# Altium schematic sheet MotorControl.SchDoc
size A
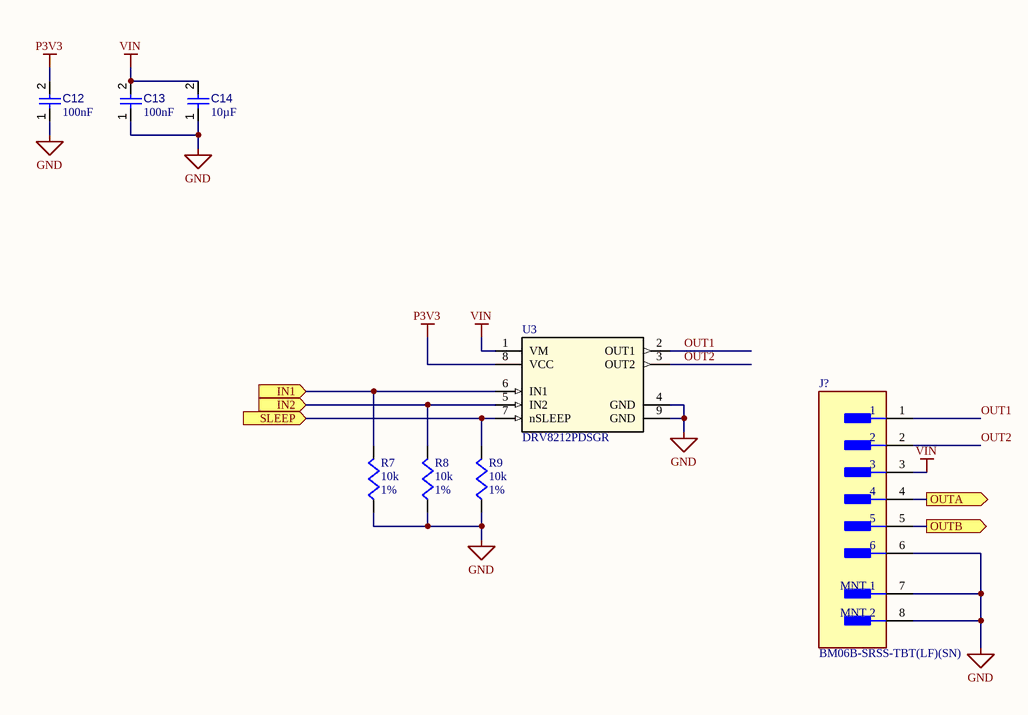
[diagram p0: MotorControl.SchDoc]

## Parts
C12  value 100nF  [CAPC0402(1005)60_L]  (hidden comment: Capacitor 100nF +/-20% 25V 0402)
C13  value 100nF  [CAPC0402(1005)60_L]  (hidden comment: Capacitor 100nF +/-20% 25V 0402)
C14  value 10µF  [CAPC2013X135X45NL10T25]  (hidden comment: Capacitor 10 uF +/- 10% 16 V 0805)
J?  BM06B-SRSS-TBT(LF)(SN)  [FP-BM06B-SRSS-TBT_LF_SN-MFG]
R7  value 10k  Tolerance: 1%  [R0402]  (hidden comment: 10k 1% 0402)
R8  value 10k  Tolerance: 1%  [R0402]  (hidden comment: 10k 1% 0402)
R9  value 10k  Tolerance: 1%  [R0402]  (hidden comment: 10k 1% 0402)
U3  DRV8212PDSGR  [WSON8_DSG_TEX]

## Ports
IN1 (in), IN2 (in), OUTA (out), OUTB (out), SLEEP (in)

## Nets
GND: C12.1 C13.1 C14.1 J?.6 J?.7(MNT_1) J?.8(MNT_2) R7.1 R8.1 R9.1 U3.4(GND) U3.9(GND)
P3V3: C12.2 U3.8(VCC)
VIN: C13.2 C14.2 J?.3 U3.1(VM)
IN1: R7.2 U3.6(IN1) ; port IN1
IN2: R8.2 U3.5(IN2) ; port IN2
OUT1: J?.1 U3.2(OUT1)
OUT2: J?.2 U3.3(OUT2)
OUTA: J?.4 ; port OUTA
OUTB: J?.5 ; port OUTB
SLEEP: R9.2 U3.7(nSLEEP) ; port SLEEP

## Library data of the parts
C12 C13 = CMP-001-00065-3: Chip Capacitor, 100nF +/-20%, 25V, 0402, Thickness 0.6 mm; Tolerance: 10%; Max Operating Temperature: 85°C; Pins: 2; Mounting Technology: SMT; Min Operating Temperature: -55°C; Case/Package: 0402; Voltage Rating: 25V
C14 = CMP-001-00015-7: Chip Capacitor, 10 uF, +/- 10%, 16 V, 0805 (2012 Metric); Voltage Rating: 16V; Capacitor Type: Ceramic; Case/Package: 0805; Max Operating Temperature: 85°C; Tolerance: 10%; Mounting Technology: SM; Pins: 2; RoHS Compliant: True; Min Operating Temperature: -55°C
J? = CMP-17439-000255-1: CONN HEADER SMD 6POS 1MM; Voltage Rating: 50V; Number of Positions: 6; Current Rating: 1A; Gender: Male; Contact Resistance: 20mR; Insulation Resistance: 100MR; Mated Stacking Heights: 4.9mm; Number of Rows: 1; Contact Type: Male Pin; Pitch: 1mm; Length: 8mm; Max Operating Temperature: 85°C; Mount: Surface Mount; Material: Polyamide; Depth: 3.6mm; Housing Color: Natural; Orientation: Straight; Termination: Solder; Package Quantity: 1; Min Operating Temperature: -25°C; Contact Shape: Square; Insulation Color: Natural; Connector Type: Header; Max Voltage Rating (DC): 50V; Insulation Material: Nylon; Flammability Rating: UL94 V-0; Color: Natural; Contact Plating: Tin; Lead Free: Lead Free; Packaging: Tape and Reel; Contact Material: Copper Alloy; Series: SR; Housing Material: Polyamide; Contact Finish - Mating: TIN; Max Voltage Rating (AC): 50V; Fastening Type: Pull; Max Current Rating: 1A
R7-R9 = CMP-009-00187-3: 62.5mW Thick Film Resistors 50V ±100ppm/℃ ±1% 10kΩ 0402 Chip Resistor - Surface Mount ROHS; Package: 0402; LCSC Part #: C60490
U3 = CMP-152-000000-2: 12-V, 3-A H-bridge motor driver, PWM control&nbsp;with low power sleep mode 8-WSON -40 to 125; Manufacturer_Name: Texas Instruments; Copyright: Copyright (C) 2026 Ultra Librarian. All rights reserved.; Type: Type; Manufacturer_Part_Number: DRV8212PDSGR; RefDes: RefDes; Source: DRV8212PDSGR.SchLib; Design Item ID: DRV8212PDSGR